# EasyEDA schematic SCH_Robectron-Chemist_2023-11-16.json
TITLE: Robectron-Chemist; REV: 1.0; Date: 2023-11-10; Sheet: 1/1; Drawn By: aimanelkhedrawi11; Company: Your Company
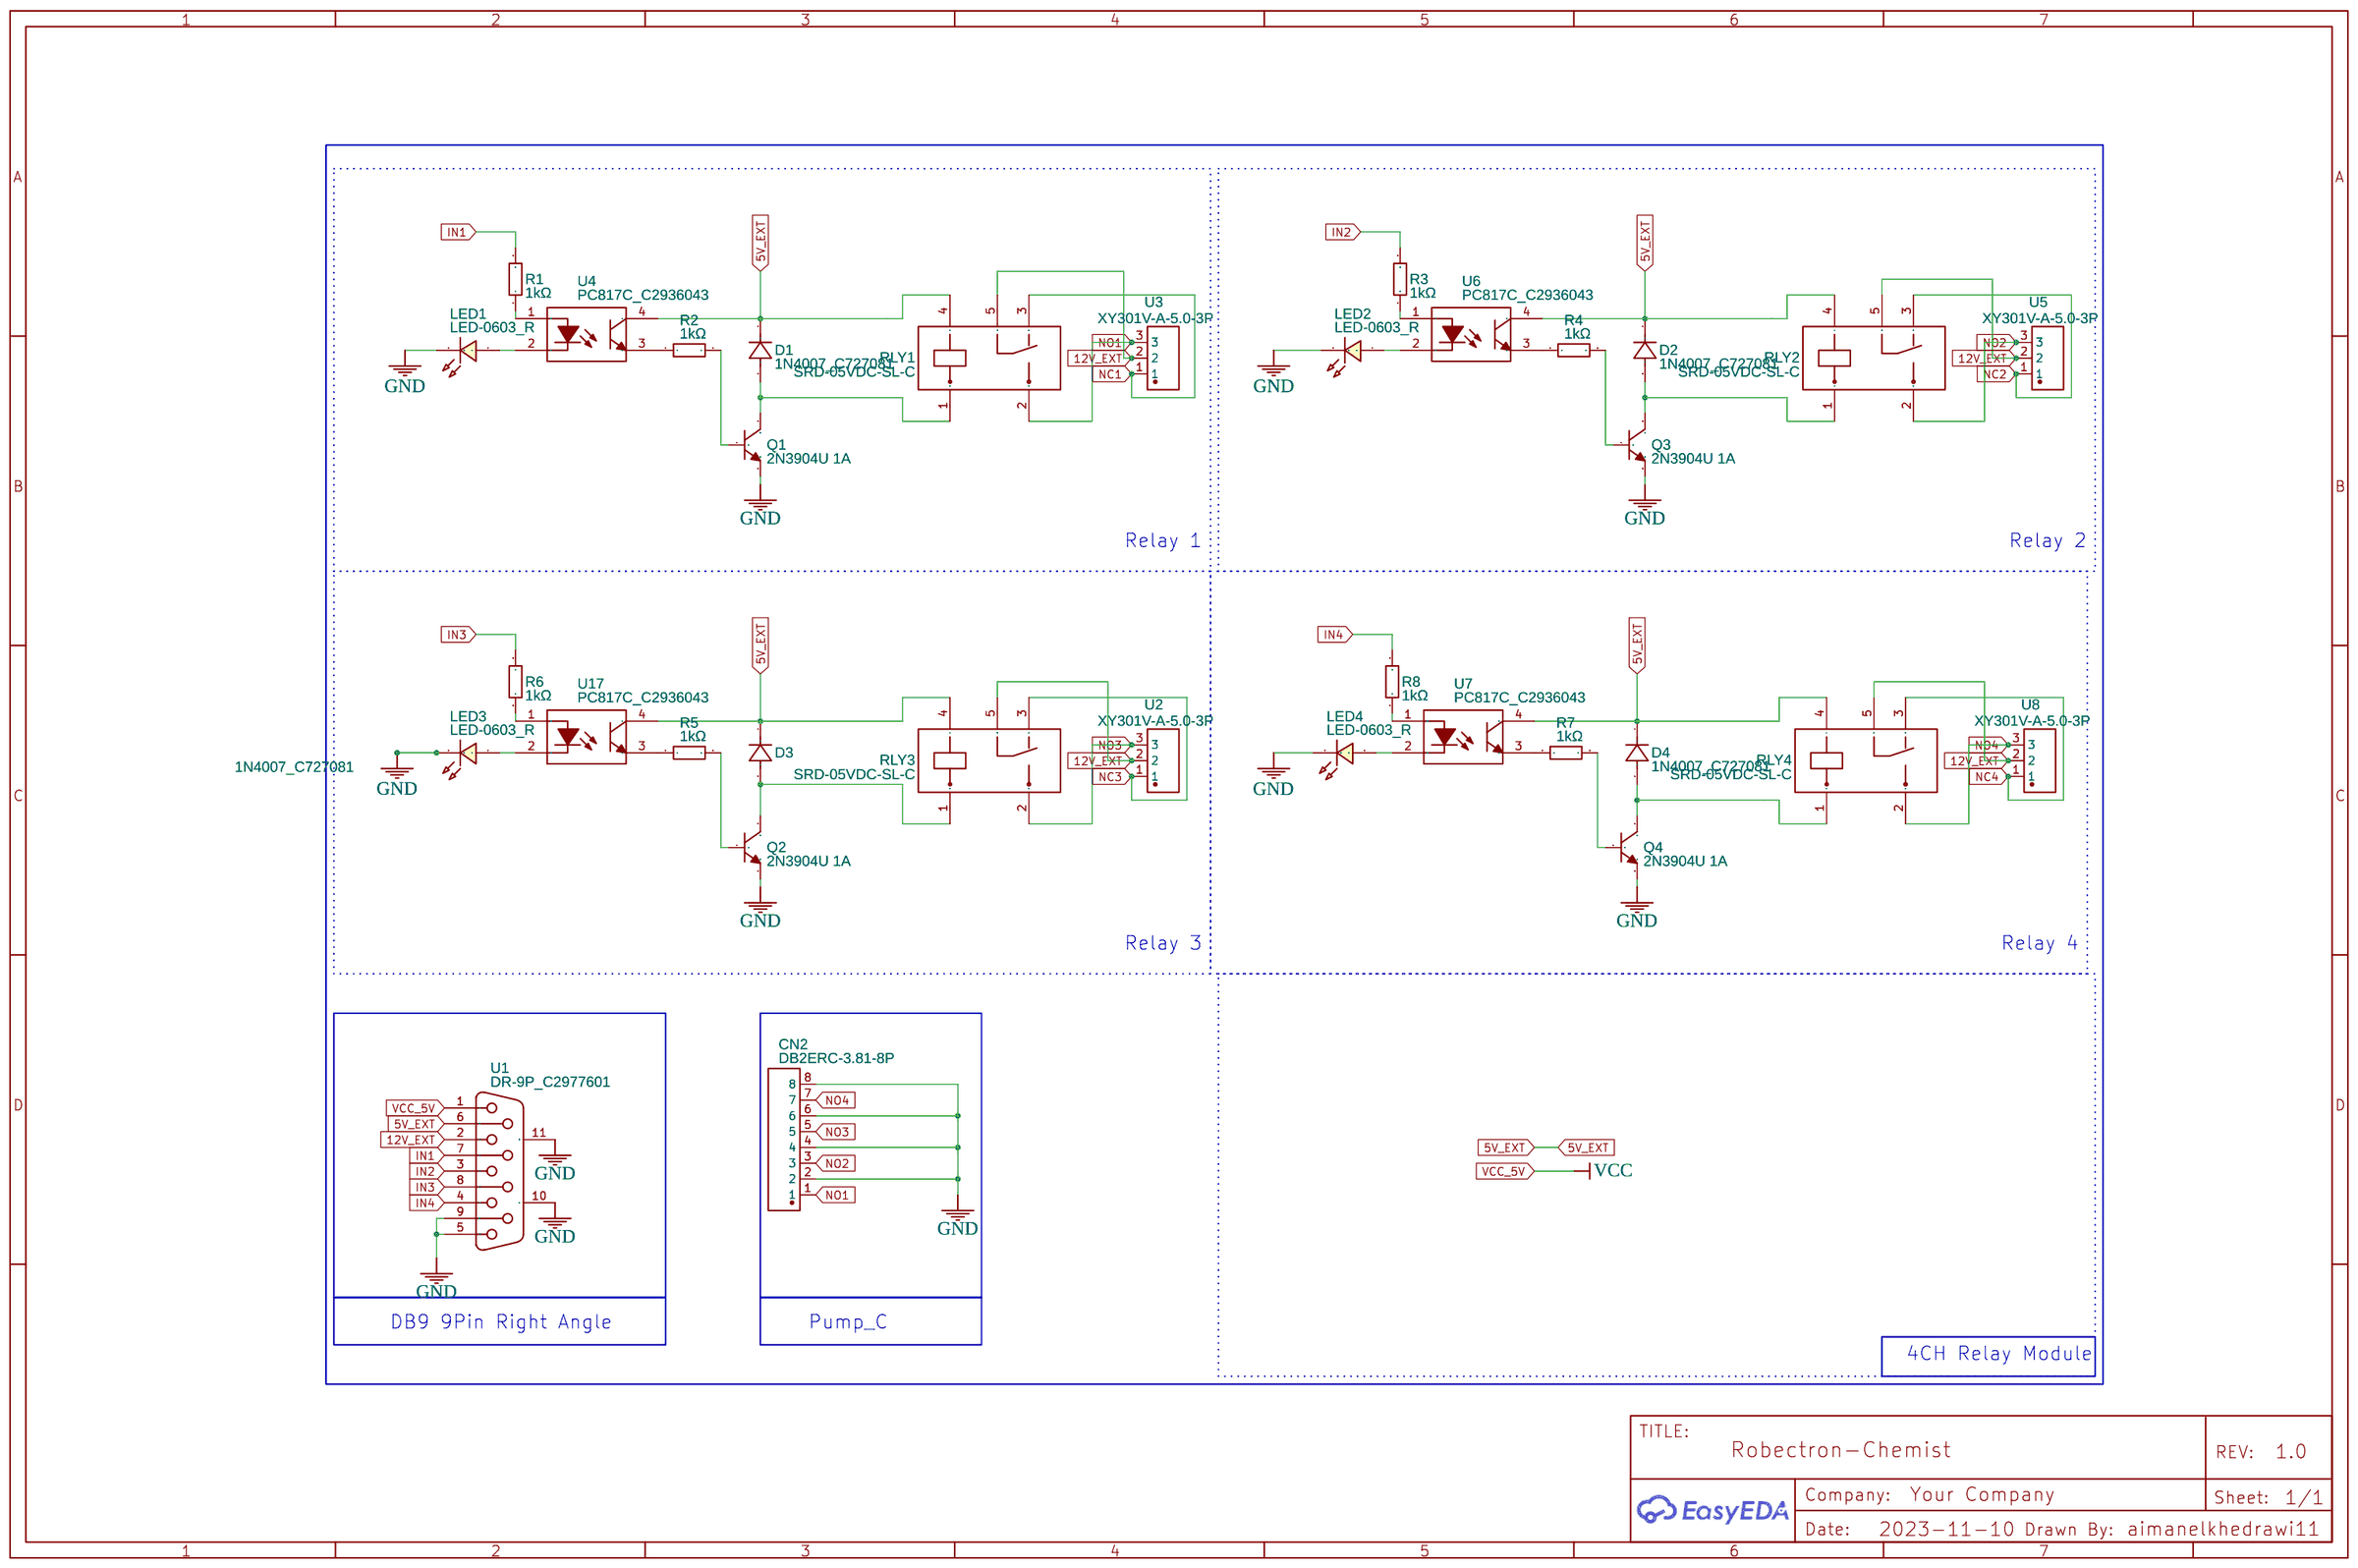
[diagram p0: schematic sheet]

## Parts
CN2  DB2ERC-3.81-8P  [CONN-TH_8P-P3.81_DB2ERC-3.81-8P]
D1  1N4007_C727081  [SMA_L4.4-W2.8-LS5.4-RD]
D2  1N4007_C727081  [SMA_L4.4-W2.8-LS5.4-RD]
D3  1N4007_C727081  [SMA_L4.4-W2.8-LS5.4-RD]
D4  1N4007_C727081  [SMA_L4.4-W2.8-LS5.4-RD]
LED1  LED-0603_R  [LED0603_RED]
LED2  LED-0603_R  [LED0603_RED]
LED3  LED-0603_R  [LED0603_RED]
LED4  LED-0603_R  [LED0603_RED]
Q1  2N3904U 1A  [SOT-89-3_L4.5-W2.5-P1.50-LS4.2-BR]
Q2  2N3904U 1A  [SOT-89-3_L4.5-W2.5-P1.50-LS4.2-BR]
Q3  2N3904U 1A  [SOT-89-3_L4.5-W2.5-P1.50-LS4.2-BR]
Q4  2N3904U 1A  [SOT-89-3_L4.5-W2.5-P1.50-LS4.2-BR]
R1  1kΩ  [R0603]
R2  1kΩ  [R0603]
R3  1kΩ  [R0603]
R4  1kΩ  [R0603]
R5  1kΩ  [R0603]
R6  1kΩ  [R0603]
R7  1kΩ  [R0603]
R8  1kΩ  [R0603]
RLY1  SRD-05VDC-SL-C  [RELAY-TH_SRD-XXVDC-XL-C]
RLY2  SRD-05VDC-SL-C  [RELAY-TH_SRD-XXVDC-XL-C]
RLY3  SRD-05VDC-SL-C  [RELAY-TH_SRD-XXVDC-XL-C]
RLY4  SRD-05VDC-SL-C  [RELAY-TH_SRD-XXVDC-XL-C]
U1  DR-9P_C2977601  [DR9-TH_ZHOUR_DR-9P-L]
U2  XY301V-A-5.0-3P  [CONN-TH_XY301V-A-5.0-3P]
U3  XY301V-A-5.0-3P  [CONN-TH_XY301V-A-5.0-3P]
U4  PC817C_C2936043  [SOP-4_L6.5-W4.6-P2.54-LS10.2-TL]
U5  XY301V-A-5.0-3P  [CONN-TH_XY301V-A-5.0-3P]
U6  PC817C_C2936043  [SOP-4_L6.5-W4.6-P2.54-LS10.2-TL]
U7  PC817C_C2936043  [SOP-4_L6.5-W4.6-P2.54-LS10.2-TL]
U8  XY301V-A-5.0-3P  [CONN-TH_XY301V-A-5.0-3P]
U17  PC817C_C2936043  [SOP-4_L6.5-W4.6-P2.54-LS10.2-TL]

## Library data of the parts
CN2 = DB2ERC-3.81-8P: Contributor: LCSC; Supplier: LCSC; Supplier Part: C395716; Manufacturer: DIBO(地博电气); Manufacturer Part: DB2ERC-3.81-8P-GN; JLCPCB Part Class: Extended Part; link: https://lcsc.com/eda_search?q=C395716&%26type=1&ref=editor
D1-D4 = 1N4007_C727081: Supplier: LCSC; Supplier Part: C727081; Manufacturer: TWGMC; Manufacturer Part: 1N4007; Contributor: LCSC; JLCPCB Part Class: Extended Part
LED1-LED4 = LED-0603_R: Manufacturer: EVERLIGHT(台湾亿光); Manufacturer Part: 19-217/R6C-AL1M2VY/3T; Supplier Part: C72044; Supplier: LCSC; Contributor: LCEDA_01
Q1-Q4 = 2N3904U 1A: Supplier: LCSC; Supplier Part: C2928256; Manufacturer: CBI(创基); Contributor: LCSC; JLCPCB Part Class: Extended Part
R1-R8 = WR06X1001FTL: Supplier: LCSC; Manufacturer: WTC; Supplier Part: C112433; Resistance (Ohms): 1K; JLCPCB Part Class: Extended Part
RLY1-RLY4 = SRD-05VDC-SL-C: Supplier: LCSC; Manufacturer: 松乐; Supplier Part: C35449; JLCPCB Part Class: Extended Part
U1 = DR-9P_C2977601: Contributor: lcsc; Supplier: LCSC; Supplier Part: C2977601; Manufacturer: null; Manufacturer Part: DR-9P; JLCPCB Part Class: Extended Part; link: https://lcsc.com/eda_search?q=C2977601&%26type=1&ref=editor
U2 U3 U5 U8 = XY301V-A-5.0-3P: Supplier: LCSC; Supplier Part: C557652; Manufacturer: XINLAIYA(新莱亚); Contributor: LCSC; JLCPCB Part Class: Extended Part
U4 U6 U7 U17 = PC817C_C2936043: Supplier: LCSC; Supplier Part: C2936043; Manufacturer: Slkor(萨科微); Manufacturer Part: PC817C; link: https://atta.szlcsc.com/upload/public/pdf/source/20211223/F034BA3A35BFF661DF174E965ECEB7BD.pdf; Contributor: LCSC; JLCPCB Part Class: Extended Part

## Nets
5V_EXT: D1.1(K) D2.1(K) D3.1(K) D4.1(K) RLY1.4 RLY2.4 RLY3.4 RLY4.4 U1.6 U4.4 U6.4 U7.4 U17.4
12V_EXT: RLY1.5 RLY2.5 RLY3.5 RLY4.5 U1.2 U2.2 U3.2 U5.2 U8.2
GND: CN2.2 CN2.4 CN2.6 CN2.8 LED1.2 LED2.2 LED3.2 LED4.2 Q1.3(E) Q2.3(E) Q3.3(E) Q4.3(E) U1.5 U1.9 U1.10(MH1) U1.11(MH2)
VCC: U1.1
IN1: R1.2 U1.7
IN2: R3.2 U1.3
IN3: R6.2 U1.8
IN4: R8.2 U1.4
NC1: RLY1.3 U3.1
NC2: RLY2.3 U5.1
NC3: RLY3.3 U2.1
NC4: RLY4.3 U8.1
NO1: CN2.1 RLY1.2 U3.3
NO2: CN2.3 RLY2.2 U5.3
NO3: CN2.5 RLY3.2 U2.3
NO4: CN2.7 RLY4.2 U8.3
Net-(D1-2): D1.2(A) Q1.2(C) RLY1.1
Net-(D2-2): D2.2(A) Q3.2(C) RLY2.1
Net-(D3-2): D3.2(A) Q2.2(C) RLY3.1
Net-(D4-2): D4.2(A) Q4.2(C) RLY4.1
Net-(LED1-1): LED1.1 U4.2
Net-(LED2-1): LED2.1 U6.2
Net-(LED3-1): LED3.1 U17.2
Net-(LED4-1): LED4.1 U7.2
Net-(Q1-1): Q1.1(B) R2.2
Net-(Q2-1): Q2.1(B) R5.2
Net-(Q3-1): Q3.1(B) R4.2
Net-(Q4-1): Q4.1(B) R7.2
Net-(R1-1): R1.1 U4.1
Net-(R2-1): R2.1 U4.3
Net-(R3-1): R3.1 U6.1
Net-(R4-1): R4.1 U6.3
Net-(R5-1): R5.1 U17.3
Net-(R6-1): R6.1 U17.1
Net-(R7-1): R7.1 U7.3
Net-(R8-1): R8.1 U7.1

## Notes on the sheet
- Relay 1
- Relay 2
- Relay 3
- Relay 4
- DB9 9Pin Right Angle
- Pump_C
- 4CH Relay Module
